# Altium project a0206-2006.PrjPcb (part 5 of 5)

## Sheet a0206-2006.17.SchDoc
size 558 x 431 mm
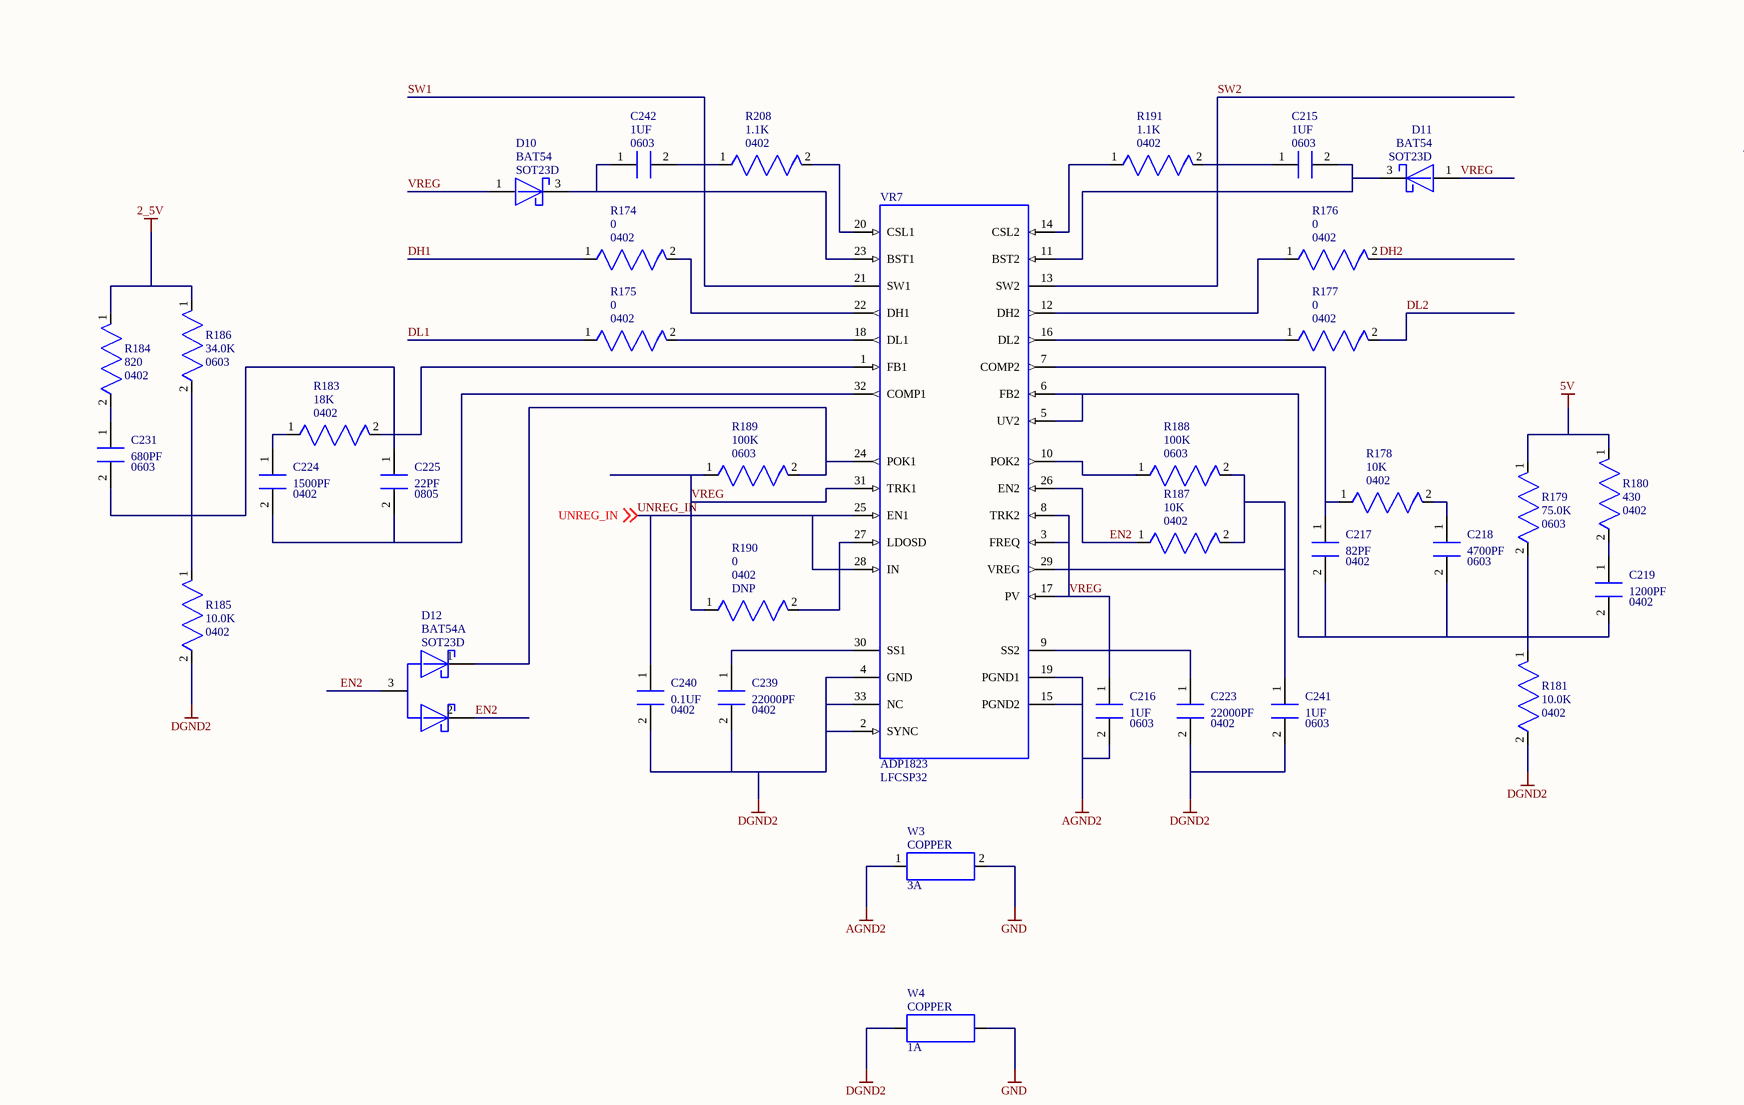
[diagram p57: a0206-2006.17.SchDoc, top left]
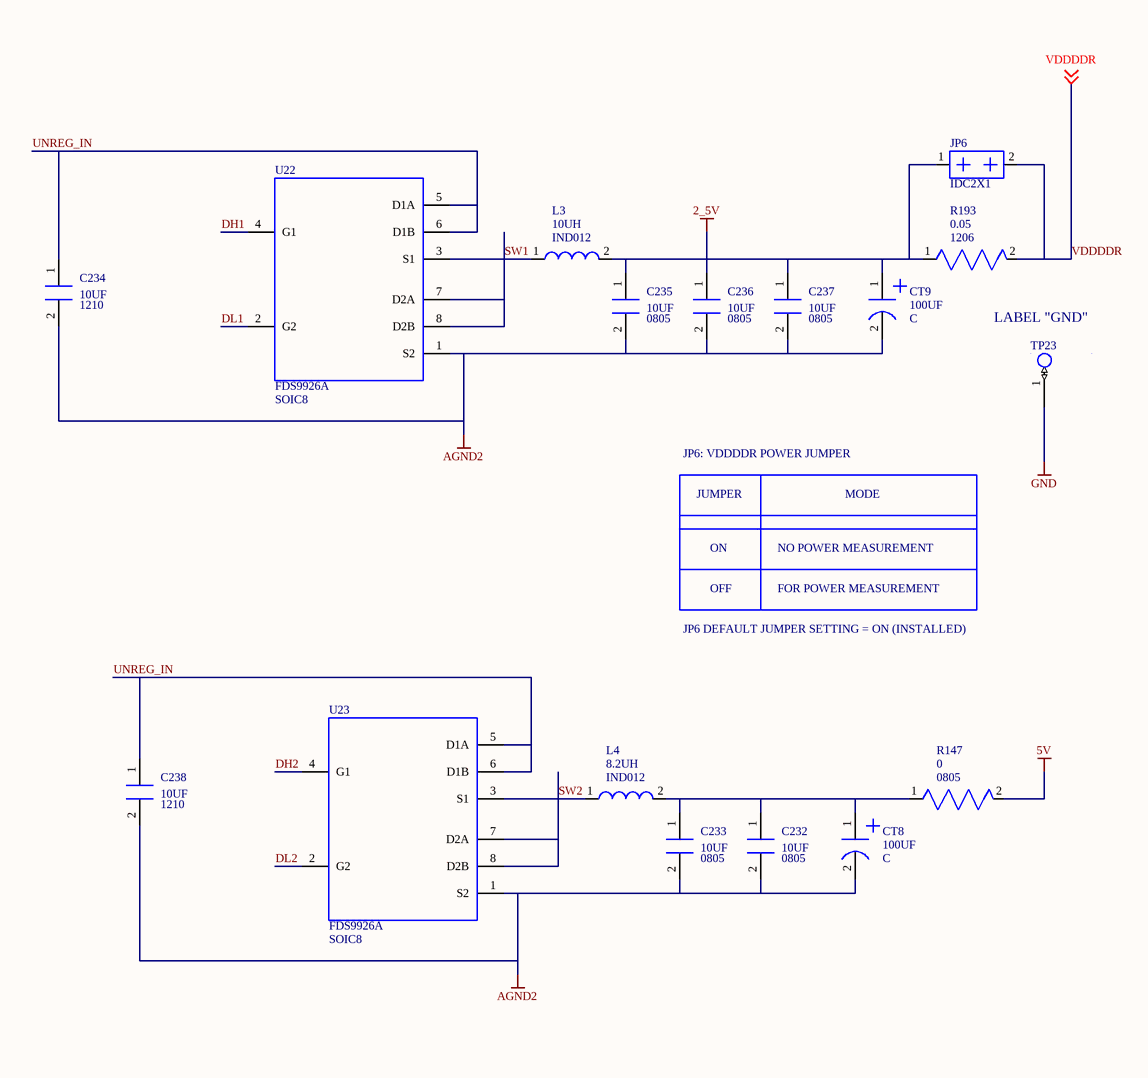
[diagram p58: a0206-2006.17.SchDoc, top right]
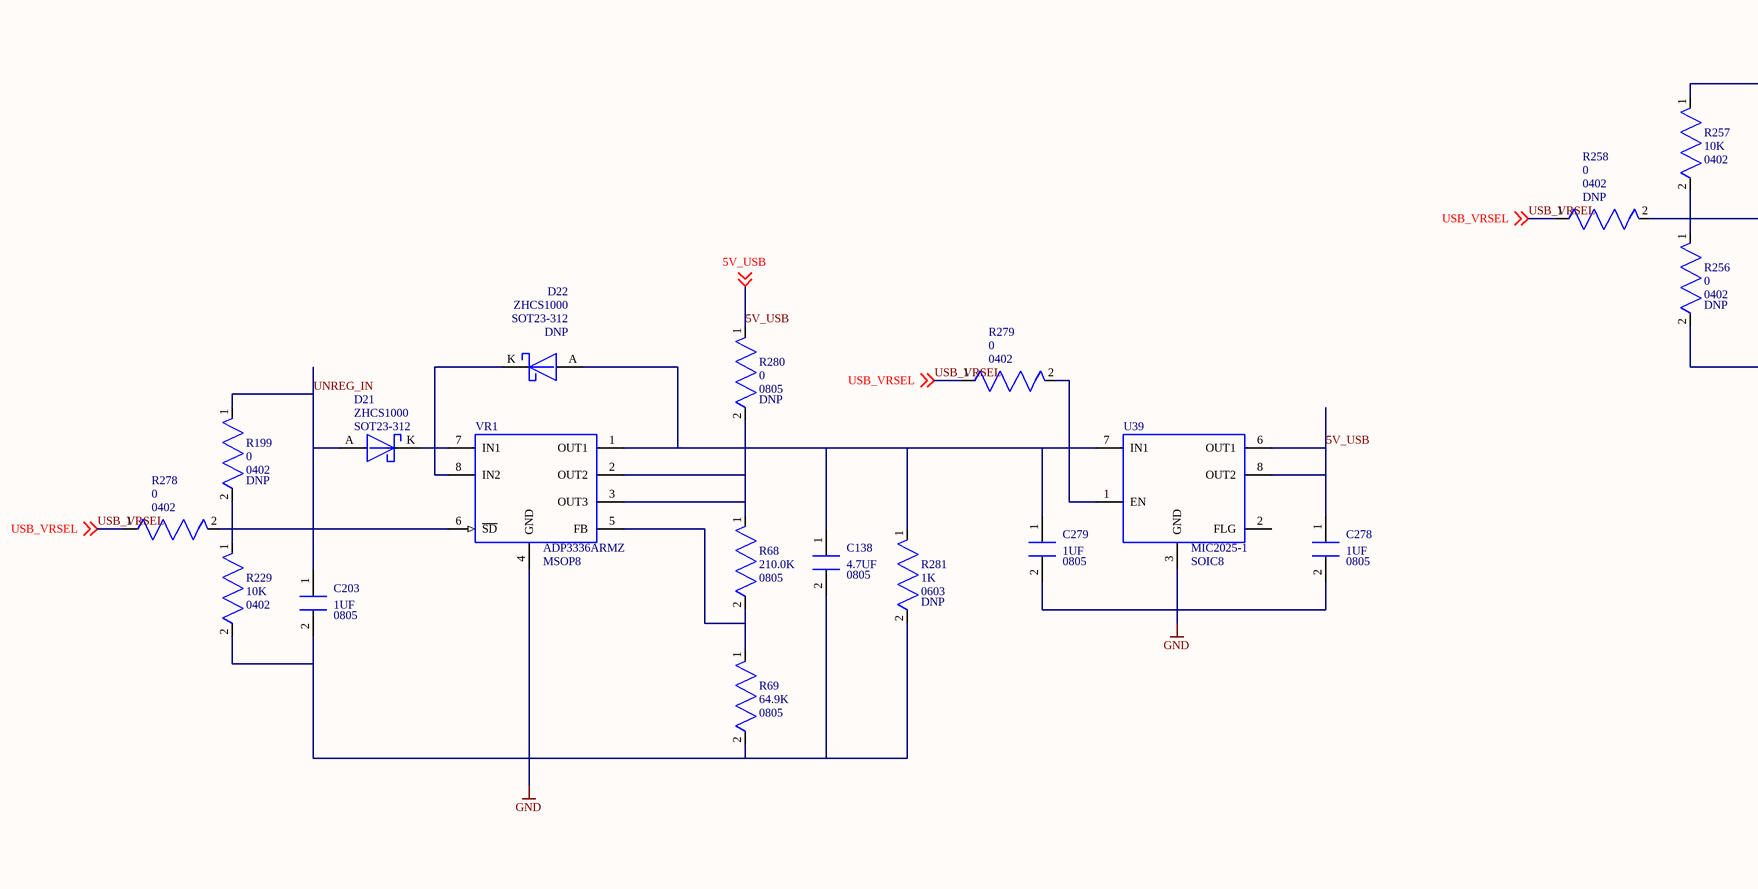
[diagram p59: a0206-2006.17.SchDoc, bottom left]
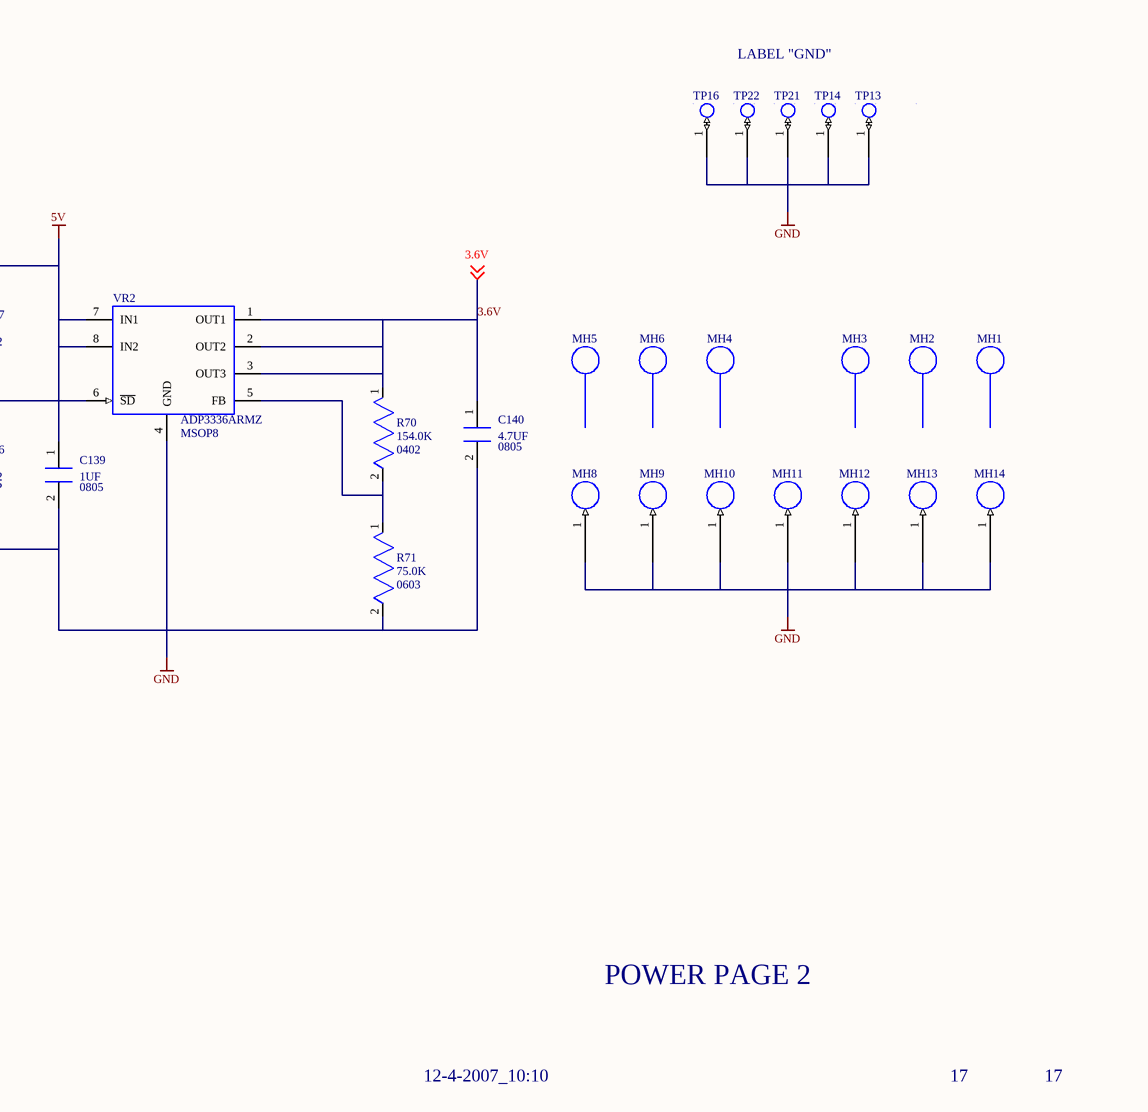
[diagram p60: a0206-2006.17.SchDoc, bottom right]

### Parts
C138  value 4.7UF  [0805]  (hidden comment: *)
C139  value 1UF  [0805]  (hidden comment: *)
C140  value 4.7UF  [0805]  (hidden comment: *)
C203  value 1UF  [0805]  (hidden comment: *)
C215  value 1UF  [0603]  (hidden comment: *)
C216  value 1UF  [0603]  (hidden comment: *)
C217  value 82PF  [0402]  (hidden comment: *)
C218  value 4700PF  [0603]  (hidden comment: *)
C219  value 1200PF  [0402]  (hidden comment: *)
C223  value 22000PF  [0402]  (hidden comment: *)
C224  value 1500PF  [0402]  (hidden comment: *)
C225  value 22PF  [0805]  (hidden comment: *)
C231  value 680PF  [0603]  (hidden comment: *)
C232  value 10UF  [0805]  (hidden comment: *)
C233  value 10UF  [0805]  (hidden comment: *)
C234  value 10UF  [1210]  (hidden comment: *)
C235  value 10UF  [0805]  (hidden comment: *)
C236  value 10UF  [0805]  (hidden comment: *)
C237  value 10UF  [0805]  (hidden comment: *)
C238  value 10UF  [1210]  (hidden comment: *)
C239  value 22000PF  [0402]  (hidden comment: *)
C240  value 0.1UF  [0402]  (hidden comment: *)
C241  value 1UF  [0603]  (hidden comment: *)
C242  value 1UF  [0603]  (hidden comment: *)
C278  value 1UF  [0805]  (hidden comment: *)
C279  value 1UF  [0805]  (hidden comment: *)
CT8  value 100UF  [C]  (hidden comment: *)
CT9  value 100UF  [C]  (hidden comment: *)
D10  PART: BAT54  [SOT23D]  (hidden comment: *)
D11  PART: BAT54  [SOT23D]  (hidden comment: *)
D12  PART: BAT54A  [SOT23D]  (hidden comment: *)
D21  PART: ZHCS1000  [SOT23-312]  (hidden comment: *)
D22  PART: ZHCS1000  CLASS: DNP  [SOT23-312]  (hidden comment: *)
JP6  *  [IDC2X1]  (value not drawn)
L3  value 10UH  [IND012]  (hidden comment: *)
L4  value 8.2UH  [IND012]  (hidden comment: *)
MH1  *  [MSC004]  (value not drawn)
MH2  *  [MSC004]  (value not drawn)
MH3  *  [MSC004]  (value not drawn)
MH4  *  [MSC004]  (value not drawn)
MH5  *  [MSC004]  (value not drawn)
MH6  *  [MSC004]  (value not drawn)
MH8  *  [MSC006]  (value not drawn)
MH9  *  [MSC006]  (value not drawn)
MH10  *  [MSC006]  (value not drawn)
MH11  *  [MSC006]  (value not drawn)
MH12  *  [MSC006]  (value not drawn)
MH13  *  [MSC006]  (value not drawn)
MH14  *  [MSC006]  (value not drawn)
R68  value 210.0K  [0805]  (hidden comment: *)
R69  value 64.9K  [0805]  (hidden comment: *)
R70  value 154.0K  [0402]  (hidden comment: *)
R71  value 75.0K  [0603]  (hidden comment: *)
R147  value 0  [0805]  (hidden comment: *)
R174  value 0  [0402]  (hidden comment: *)
R175  value 0  [0402]  (hidden comment: *)
R176  value 0  [0402]  (hidden comment: *)
R177  value 0  [0402]  (hidden comment: *)
R178  value 10K  [0402]  (hidden comment: *)
R179  value 75.0K  [0603]  (hidden comment: *)
R180  value 430  [0402]  (hidden comment: *)
R181  value 10.0K  [0402]  (hidden comment: *)
R183  value 18K  [0402]  (hidden comment: *)
R184  value 820  [0402]  (hidden comment: *)
R185  value 10.0K  [0402]  (hidden comment: *)
R186  value 34.0K  [0603]  (hidden comment: *)
R187  value 10K  [0402]  (hidden comment: *)
R188  value 100K  [0603]  (hidden comment: *)
R189  value 100K  [0603]  (hidden comment: *)
R190  value 0  CLASS: DNP  [0402]  (hidden comment: *)
R191  value 1.1K  [0402]  (hidden comment: *)
R193  value 0.05  [1206]  (hidden comment: *)
R199  value 0  CLASS: DNP  [0402]  (hidden comment: *)
R208  value 1.1K  [0402]  (hidden comment: *)
R229  value 10K  [0402]  (hidden comment: *)
R256  value 0  CLASS: DNP  [0402]  (hidden comment: *)
R257  value 10K  [0402]  (hidden comment: *)
R258  value 0  CLASS: DNP  [0402]  (hidden comment: *)
R278  value 0  [0402]  (hidden comment: *)
R279  value 0  [0402]  (hidden comment: *)
R280  value 0  CLASS: DNP  [0805]  (hidden comment: *)
R281  value 1K  CLASS: DNP  [0603]  (hidden comment: *)
TP13  *  [TP]  (value not drawn)
TP14  *  [TP]  (value not drawn)
TP16  *  [TP]  (value not drawn)
TP21  *  [TP]  (value not drawn)
TP22  *  [TP]  (value not drawn)
TP23  *  [TP]  (value not drawn)
U22  PART: FDS9926A  [SOIC8]  (hidden comment: *)
U23  PART: FDS9926A  [SOIC8]  (hidden comment: *)
U39  PART: MIC2025-1  [SOIC8]  (hidden comment: *)
VR1  PART: ADP3336ARMZ  [MSOP8]  (hidden comment: *)
VR2  PART: ADP3336ARMZ  [MSOP8]  (hidden comment: *)
VR7  PART: ADP1823  [LFCSP32]  (hidden comment: *)
W3  value COPPER  [3A]  (hidden comment: *)
W4  value COPPER  [1A]  (hidden comment: *)

### Nets
2_5V: C235.1(A) C236.1(A) C237.1(A) CT9.1(P) JP6.1 L3.2(B) R184.1(N1) R186.1(N1) R193.1(N1)
5V: C139.1(A) R147.2(N2) R179.1(N1) R180.1(N1) R257.1(N1) VR2.7(IN1) VR2.8(IN2)
AGND2: C216.2(B) C232.2(B) C233.2(B) C234.2(B) C235.2(B) C236.2(B) C237.2(B) C238.2(B) CT8.2(N) CT9.2(N) U22.1(S2) U23.1(S2) VR7.15(PGND2) VR7.19(PGND1) W3.1(N1)
DGND2: C223.2(B) C239.2(B) C240.2(B) C241.2(B) R181.2(N2) R185.2(N2) VR7.2(SYNC) VR7.4(GND) VR7.33(NC) W4.1(N1)
GND: C138.2(B) C139.2(B) C140.2(B) C203.2(B) C278.2(B) C279.2(B) MH8.1(TP) MH9.1(TP) MH10.1(TP) MH11.1(TP) MH12.1(TP) MH13.1(TP) MH14.1(TP) R69.2(N2) R71.2(N2) R229.2(N2) R256.2(N2) R281.2(N2) TP13.1(TP) TP14.1(TP) TP16.1(TP) TP21.1(TP) TP22.1(TP) TP23.1(TP) U39.3(GND) VR1.4(GND) VR2.4(GND) W3.2(N2) W4.2(N2)
3.6V: C140.1(A) R70.1(N1) VR2.1(OUT1) VR2.2(OUT2) VR2.3(OUT3) ; off-sheet 3.6V
5V_USB: C278.1(A) R280.1(N1) U39.6(OUT1) U39.8(OUT2) ; off-sheet 5V_USB
DH1: R174.1(N1) U22.4(G1)
DH2: R176.2(N2) U23.4(G1)
DL1: R175.1(N1) U22.2(G2)
DL2: R177.2(N2) U23.2(G2)
EN2: D12.2(CATHODE_B) D12.3(ANODE) R187.1(N1) VR7.26(EN2)
SW1: C242.2(B) L3.1(A) R208.1(N1) U22.3(S1) U22.7(D2A) U22.8(D2B) VR7.21(SW1)
SW2: C215.1(A) L4.1(A) R191.2(N2) U23.3(S1) U23.7(D2A) U23.8(D2B) VR7.13(SW2)
UNREG_IN: C203.1(A) C234.1(A) C238.1(A) C240.1(A) D21.A(ANODE) R199.1(N1) U22.5(D1A) U22.6(D1B) U23.5(D1A) U23.6(D1B) VR7.25(EN1) VR7.28(IN) ; off-sheet UNREG_IN
USB_VRSEL: R258.1(N1) R278.1(N1) R279.1(N1) ; off-sheet USB_VRSEL
VDDDDR: JP6.2 R193.2(N2) ; off-sheet VDDDDR
VREG: C216.1(A) C241.1(A) D10.1(ANODE) D11.1(ANODE) R187.2(N2) R188.2(N2) R189.1(N1) R190.1(N1) VR7.3(FREQ) VR7.8(TRK2) VR7.17(PV) VR7.29(VREG) VR7.31(TRK1)
NetC138_1: C138.1(A) C279.1(A) D22.A(ANODE) R68.1(N1) R280.2(N2) R281.1(N1) U39.7(IN1) VR1.1(OUT1) VR1.2(OUT2) VR1.3(OUT3)
NetC215_2: C215.2(B) D11.3(CATHODE) VR7.11(BST2)
NetC217_1: C217.1(A) R178.1(N1) VR7.7(COMP2)
NetC217_2: C217.2(B) C218.2(B) C219.2(B) R179.2(N2) R181.1(N1) VR7.5(UV2) VR7.6(FB2)
NetC218_1: C218.1(A) R178.2(N2)
NetC219_1: C219.1(A) R180.2(N2)
NetC223_1: C223.1(A) VR7.9(SS2)
NetC224_1: C224.1(A) R183.1(N1)
NetC224_2: C224.2(B) C225.2(B) VR7.32(COMP1)
NetC225_1: C225.1(A) C231.2(B) R183.2(N2) R185.1(N1) R186.2(N2) VR7.1(FB1)
NetC231_1: C231.1(A) R184.2(N2)
NetC232_1: C232.1(A) C233.1(A) CT8.1(P) L4.2(B) R147.1(N1)
NetC239_1: C239.1(A) VR7.30(SS1)
NetC242_1: C242.1(A) D10.3(CATHODE) VR7.23(BST1)
NetD12_1: D12.1(CATHODE_A) R189.2(N2) VR7.24(POK1)
NetD21_K: D21.K(CATHODE) D22.K(CATHODE) VR1.7(IN1) VR1.8(IN2)
NetR68_2: R68.2(N2) R69.1(N1) VR1.5(FB)
NetR70_2: R70.2(N2) R71.1(N1) VR2.5(FB)
NetR174_2: R174.2(N2) VR7.22(DH1)
NetR175_2: R175.2(N2) VR7.18(DL1)
NetR176_1: R176.1(N1) VR7.12(DH2)
NetR177_1: R177.1(N1) VR7.16(DL2)
NetR188_1: R188.1(N1) VR7.10(POK2)
NetR190_2: R190.2(N2) VR7.27(LDOSD)
NetR191_1: R191.1(N1) VR7.14(CSL2)
NetR199_2: R199.2(N2) R229.1(N1) R278.2(N2) VR1.6(~{SD})
NetR208_2: R208.2(N2) VR7.20(CSL1)
NetR256_1: R256.1(N1) R257.2(N2) R258.2(N2) VR2.6(~{SD})
NetR279_2: R279.2(N2) U39.1(EN)

Not connected (* = marked no-connect by the designer): D10 2; D11 2; MH1 1; MH2 1; MH3 1; MH4 1; MH5 1; MH6 1; U39 2(FLG) 4 5

### Notes on the sheet
- LABEL "GND"
- JP6: VDDDDR POWER JUMPER
- JUMPER
- ON
- NO POWER MEASUREMENT
- MODE
- OFF
- FOR POWER MEASUREMENT
- JP6 DEFAULT JUMPER SETTING = ON (INSTALLED)
- POWER PAGE 2
- 12-4-2007_10:10
- 17
- A
- B
- C
- D
- 1
- 2
- 3
- 20 Cotton Road
- 4
- DEVICES
- ANALOG
- Nashua, NH 03063
- PH: 1-800-ANALOGD
- Title
- ADSP-BF548 EZ-KIT LITE
- Size
- Board No.
- A0206-2006
- Rev
- 1.4B
- Date
- Sheet
- of

### Library data of the parts
C138 = CAP_NON_POLARIZED.2: PART_SPEC: CAPACITOR; LEVEL: STD; PRT_NUM: 7000275; VOLTAGE: 6.3V; TOLERANCE: 10%; TYPE: X5R; PKG_TYPE: 0805; ROHS: ROHS
C139 C278 = CAP_NON_POLARIZED.2: PART_SPEC: CAPACITOR; LEVEL: STD; TYPE: X7R; TOLERANCE: 10%; VOLTAGE: 16V; PRT_NUM: 7000143; PKG_TYPE: 0805; ROHS: ROHS
C140 = CAP_NON_POLARIZED.2: PART_SPEC: CAPACITOR; LEVEL: STD; TYPE: X5R; TOLERANCE: 10%; VOLTAGE: 6.3V; PRT_NUM: 7000275; PKG_TYPE: 0805; ROHS: ROHS
C203 C279 = CAP_NON_POLARIZED.2: PART_SPEC: CAPACITOR; LEVEL: STD; PRT_NUM: 7000143; VOLTAGE: 16V; TOLERANCE: 10%; TYPE: X7R; PKG_TYPE: 0805; ROHS: ROHS
C215 C242 = CAP_NON_POLARIZED.1: PART_SPEC: CAPACITOR; LEVEL: STD; PRT_NUM: 7000344; TYPE: X5R; VOLTAGE: 16V; TOLERANCE: 10%; PKG_TYPE: 0603; ROHS: ROHS
C216 = CAP_NON_POLARIZED.2: PART_SPEC: CAPACITOR; LEVEL: STD; TOLERANCE: 10%; VOLTAGE: 16V; TYPE: X5R; PRT_NUM: 7000344; PKG_TYPE: 0603; ROHS: ROHS
C217 = CAP_NON_POLARIZED.2: PART_SPEC: CAPACITOR; LEVEL: STD; PRT_NUM: 7000548; TYPE: NPO; VOLTAGE: 50V; TOLERANCE: 5%; PKG_TYPE: 0402; ROHS: ROHS
C218 = CAP_NON_POLARIZED.2: PART_SPEC: CAPACITOR; LEVEL: STD; PRT_NUM: 7000387; TYPE: X7R; VOLTAGE: 16V; TOLERANCE: 10%; PKG_TYPE: 0603; ROHS: ROHS
C219 = CAP_NON_POLARIZED.2: PART_SPEC: CAPACITOR; LEVEL: STD; PRT_NUM: 7000546; TYPE: X7R; VOLTAGE: 50V; TOLERANCE: 10%; PKG_TYPE: 0402; ROHS: ROHS
C223 C239 = CAP_NON_POLARIZED.2: PART_SPEC: CAPACITOR; LEVEL: STD; PRT_NUM: 7000549; TYPE: X7R; VOLTAGE: 25V; TOLERANCE: 10%; PKG_TYPE: 0402; ROHS: ROHS
C224 = CAP_NON_POLARIZED.2: PART_SPEC: CAPACITOR; LEVEL: STD; PRT_NUM: 7000550; TYPE: X7R; VOLTAGE: 50V; TOLERANCE: 10%; PKG_TYPE: 0402; ROHS: ROHS
C225 = CAP_NON_POLARIZED.2: PART_SPEC: CAPACITOR; LEVEL: STD; PRT_NUM: 7000028; TYPE: NPO; VOLTAGE: 50V; TOLERANCE: 5%; PKG_TYPE: 0805; ROHS: ROHS
C231 = CAP_NON_POLARIZED.2: PART_SPEC: CAPACITOR; LEVEL: STD; PRT_NUM: 7000413; TYPE: NPO; VOLTAGE: 50V; TOLERANCE: 5%; PKG_TYPE: 0603; ROHS: ROHS
C232 C236 = CAP_NON_POLARIZED.2: PART_SPEC: CAPACITOR; LEVEL: STD; TOLERANCE: 10%; VOLTAGE: 6.3V; TYPE: X5R; PRT_NUM: 7000265; PKG_TYPE: 0805; ROHS: ROHS
C233 C235 C237 = CAP_NON_POLARIZED.2: PART_SPEC: CAPACITOR; LEVEL: STD; PRT_NUM: 7000265; TYPE: X5R; VOLTAGE: 6.3V; TOLERANCE: 10%; PKG_TYPE: 0805; ROHS: ROHS
C234 = CAP_NON_POLARIZED.2: PART_SPEC: CAPACITOR; LEVEL: STD; PRT_NUM: 7000492; TYPE: X5R; VOLTAGE: 16V; TOLERANCE: 10%; PKG_TYPE: 1210; ROHS: ROHS
C238 = CAP_NON_POLARIZED.2: PART_SPEC: CAPACITOR; LEVEL: STD; TOLERANCE: 10%; VOLTAGE: 16V; TYPE: X5R; PRT_NUM: 7000492; PKG_TYPE: 1210; ROHS: ROHS
C240 = CAP_NON_POLARIZED.2: PART_SPEC: CAPACITOR; LEVEL: STD; PRT_NUM: 7000278; TYPE: X5R; VOLTAGE: 10V; TOLERANCE: 10%; PKG_TYPE: 0402; ROHS: ROHS
C241 = CAP_NON_POLARIZED.2: PART_SPEC: CAPACITOR; LEVEL: STD; PRT_NUM: 7000344; TYPE: X5R; VOLTAGE: 16V; TOLERANCE: 10%; PKG_TYPE: 0603; ROHS: ROHS
CT8 = CAP_POLARIZED.3: PART_SPEC: CAPACITOR; LEVEL: STD; PRT_NUM: 7000303; VOLTAGE: 10V; TOLERANCE: 10%; PKG_TYPE: C; TYPE: TANT-LOW-ESR; ROHS: ROHS
CT9 = CAP_POLARIZED.3: PART_SPEC: CAPACITOR; LEVEL: STD; TOLERANCE: 10%; VOLTAGE: 10V; PRT_NUM: 7000303; PKG_TYPE: C; ROHS: ROHS; TYPE: TANT-LOW-ESR
D10 D11 = DIO_SCHOTTYKY_BAT54.1: SCHOTTKY 30V SINGLE; LEVEL: STD; CURRENT: 200MA; NC: 2; PRT_NUM: 7000534; PKG_TYPE: SOT23D; ROHS: ROHS; WEB: http://www.fairchildsemi.com/pf/BA/BAT54.html
D12 = DIO_SCHOTTYKY_BAT54A.1: SCHOTTKY 30V DUAL; LEVEL: STD; CURRENT: 200MA; PRT_NUM: 7000533; PKG_TYPE: SOT23D; ROHS: ROHS; WEB: http://www.fairchildsemi.com/pf/BA/BAT54A.html
D21 D22 = DIO_SCHOTTKY_3.3: SCHOTTKY; LEVEL: STD; CURRENT: 1A; PRT_NUM: 7000252; PKG_TYPE: SOT23-312; WEB: http://www.zetex.com/3.0/3-3-3.asp?pn; ROHS: ROHS
JP6 = CON_2X1.2: HEADER; PART_SPEC: CONNECTOR; LEVEL: STD; PRT_NUM: 6000774; CONFIGURATION: 2X1; PKG_TYPE: IDC2X1; TYPE: IDC; ROHS: ROHS
L3 = IND_STANDARD.1: PART_SPEC: INDUCTOR; LEVEL: STD; PRT_NUM: 7000536; TOLERANCE: 20%; PKG_TYPE: IND012; ROHS: ROHS
L4 = IND_STANDARD.1: PART_SPEC: INDUCTOR; LEVEL: STD; PRT_NUM: 7000535; TOLERANCE: 20%; PKG_TYPE: IND012; ROHS: ROHS
MH1-MH6 = MSC_MOUNTING_HOLE_NC.1: MOUNTING HOLE; NC: 1; CLASS: DNP; LEVEL: STD; ROHS: ROHS; PART: HOLE; PART_SPEC: HOLE; PKG_TYPE: MSC004
MH8-MH14 = MSC_MOUNTING_HOLE.1: MOUNTING HOLE; CLASS: DNP; LEVEL: STD; ROHS: ROHS; PART: HOLE; PART_SPEC: HOLE; PKG_TYPE: MSC006
R68 = RES_STANDARD.2: PART_SPEC: RESISTOR; LEVEL: STD; TOLERANCE: 1%; PRT_NUM: 7000311; POWER: 1/4W; PKG_TYPE: 0805; ROHS: ROHS
R69 = RES_STANDARD.2: PART_SPEC: RESISTOR; LEVEL: STD; TOLERANCE: 1%; PRT_NUM: 7000309; POWER: 1/10W; PKG_TYPE: 0805; ROHS: ROHS
R70 = RES_STANDARD.2: PART_SPEC: RESISTOR; LEVEL: STD; POWER: 1/16W; PRT_NUM: 7000576; TOLERANCE: 1%; PKG_TYPE: 0402; ROHS: ROHS
R71 = RES_STANDARD.2: PART_SPEC: RESISTOR; LEVEL: STD; POWER: 1/16W; PRT_NUM: 7000378; TOLERANCE: 1%; PKG_TYPE: 0603; ROHS: ROHS
R147 = RES_STANDARD.1: PART_SPEC: RESISTOR; LEVEL: STD; PRT_NUM: 7000228; POWER: 1/10W; TOLERANCE: 5%; PKG_TYPE: 0805; ROHS: ROHS
R174-R177 R278 = RES_STANDARD.1: PART_SPEC: RESISTOR; LEVEL: STD; PRT_NUM: 7000282; POWER: 1/16W; TOLERANCE: 5%; PKG_TYPE: 0402; ROHS: ROHS
R178 R187 = RES_STANDARD.1: PART_SPEC: RESISTOR; LEVEL: STD; PRT_NUM: 7000280; POWER: 1/16W; TOLERANCE: 5%; PKG_TYPE: 0402; ROHS: ROHS
R179 = RES_STANDARD.2: PART_SPEC: RESISTOR; LEVEL: STD; PRT_NUM: 7000378; POWER: 1/16W; TOLERANCE: 1%; PKG_TYPE: 0603; ROHS: ROHS
R180 = RES_STANDARD.2: PART_SPEC: RESISTOR; LEVEL: STD; PRT_NUM: 7000544; POWER: 1/16W; TOLERANCE: 1%; PKG_TYPE: 0402; ROHS: ROHS
R181 R185 = RES_STANDARD.2: PART_SPEC: RESISTOR; LEVEL: STD; PRT_NUM: 7000582; POWER: 1/16W; TOLERANCE: 1%; PKG_TYPE: 0402; ROHS: ROHS
R183 = RES_STANDARD.1: PART_SPEC: RESISTOR; LEVEL: STD; PRT_NUM: 7000539; POWER: 1/16W; TOLERANCE: 5%; PKG_TYPE: 0402; ROHS: ROHS
R184 = RES_STANDARD.2: PART_SPEC: RESISTOR; LEVEL: STD; PRT_NUM: 7000542; POWER: 1/16W; TOLERANCE: 5%; PKG_TYPE: 0402; ROHS: ROHS
R186 = RES_STANDARD.2: PART_SPEC: RESISTOR; LEVEL: STD; PRT_NUM: 7000609; POWER: 1/10W; TOLERANCE: 1%; PKG_TYPE: 0603; ROHS: ROHS
R188 = RES_STANDARD.1: PART_SPEC: RESISTOR; LEVEL: STD; TOLERANCE: 5%; POWER: 1/10W; PRT_NUM: 7000367; PKG_TYPE: 0603; ROHS: ROHS
R189 = RES_STANDARD.1: PART_SPEC: RESISTOR; LEVEL: STD; PRT_NUM: 7000367; POWER: 1/10W; TOLERANCE: 5%; PKG_TYPE: 0603; ROHS: ROHS
R190 R258 R279 = RES_STANDARD.1: PART_SPEC: RESISTOR; LEVEL: STD; TOLERANCE: 5%; POWER: 1/16W; PRT_NUM: 7000282; PKG_TYPE: 0402; ROHS: ROHS
R191 R208 = RES_STANDARD.1: PART_SPEC: RESISTOR; LEVEL: STD; PRT_NUM: 7000538; POWER: 1/16W; TOLERANCE: 1%; PKG_TYPE: 0402; ROHS: ROHS
R193 = RES_STANDARD.1: PART_SPEC: RESISTOR; LEVEL: STD; TOLERANCE: 1%; POWER: 1/2W; PRT_NUM: 7000486; PKG_TYPE: 1206; ROHS: ROHS
R199 = RES_STANDARD.2: PART_SPEC: RESISTOR; LEVEL: STD; TOLERANCE: 5%; POWER: 1/16W; PRT_NUM: 7000282; PKG_TYPE: 0402; ROHS: ROHS
R229 = RES_STANDARD.2: PART_SPEC: RESISTOR; LEVEL: STD; PRT_NUM: 7000280; POWER: 1/16W; TOLERANCE: 5%; PKG_TYPE: 0402; ROHS: ROHS
R256 = RES_STANDARD.2: PART_SPEC: RESISTOR; LEVEL: STD; PRT_NUM: 7000282; POWER: 1/16W; TOLERANCE: 5%; PKG_TYPE: 0402; ROHS: ROHS
R257 = RES_STANDARD.2: PART_SPEC: RESISTOR; LEVEL: STD; TOLERANCE: 5%; POWER: 1/16W; PRT_NUM: 7000280; PKG_TYPE: 0402; ROHS: ROHS
R280 = RES_STANDARD.2: PART_SPEC: RESISTOR; LEVEL: STD; PRT_NUM: 7000228; POWER: 1/10W; TOLERANCE: 5%; PKG_TYPE: 0805; ROHS: ROHS
R281 = RES_STANDARD.2: PART_SPEC: RESISTOR; LEVEL: STD; POWER: 1/10W; PRT_NUM: 7000384; TOLERANCE: 5%; PKG_TYPE: 0603; ROHS: ROHS
TP13 TP14 TP16 TP21-TP23 = MSC_TEST_POINT.1: TESTPOINT; CLASS: DNP; LEVEL: STD; BOARDS: BOTH; PART_SPEC: TESTPOINT; PART: TESTPOINT; ROHS: ROHS; PKG_TYPE: TP
U22 U23 = ICS_FDS9926A.1: 2.5V DUAL N-MOSFETS; LEVEL: STD; PRT_NUM: 1000413; WEB: http://www.fairchildsemi.com/pf/FD/FDS9926A.html; PKG_TYPE: SOIC8; ROHS: ROHS
U39 = ICS_MIC2025.1: PWR DIST MOSFET 0.5A; LEVEL: STD; NC: 4,5; PRT_NUM: 1000443; WEB: http://www.micrel.com/_PDF/mic2025.pdf; PKG_TYPE: SOIC8; ROHS: ROHS
VR1 VR2 = ICS_ADP3336.1: ADJ 500MA REGULATOR; LEVEL: STD; PRT_NUM: 30-025190-01; PKG_TYPE: MSOP8; WEB: HTTP://WWW.ANALOG.COM/EN/PROD/0%2C2877%2CADP3336%2C00.HTML; ROHS: ROHS
VR7 = ICS_ADP1823.1: DUAL STEPDOWN CONTROLLER; LEVEL: STD; PRT_NUM: 30-025759-01; WEB: http://www.analog.com/en/prod/0,2877,ADP1823,00.html; PKG_TYPE: LFCSP32; ROHS: ROHS
W3 W4 = MSC_COPPER.1: LEVEL: STD; CLASS: DNP
  W3: PKG_TYPE: 3A
  W4: PKG_TYPE: 1A

## Nets that join several sheets
2_5V: a0206-2006.2 (19 pins), a0206-2006.17 (9 pins)
3V: a0206-2006.3 (28 pins), a0206-2006.4 (10 pins), a0206-2006.5 (10 pins), a0206-2006.7 (5 pins), a0206-2006.8 (10 pins), a0206-2006.9 (29 pins), a0206-2006.10 (10 pins), a0206-2006.11 (7 pins), mxvr.1 (C22.1 R231.1 U8.4), a0206-2006.12 (17 pins), a0206-2006.13 (20 pins), a0206-2006.14 (15 pins), a0206-2006.15 (15 pins), a0206-2006.16 (18 pins)
5V: a0206-2006.8 (9 pins), a0206-2006.10 (6 pins), mxvr.1 (6 pins), a0206-2006.12 (6 pins), a0206-2006.14 (6 pins), a0206-2006.15 (10 pins), a0206-2006.17 (7 pins)
A5V: a0206-2006.7 (8 pins), a0206-2006.16 (C204.1 FER17.2)
AGND: a0206-2006.7 (41 pins), a0206-2006.16 (C204.2)
GND: a0206-2006.2 (19 pins), a0206-2006.3 (19 pins), a0206-2006.4 (8 pins), a0206-2006.5 (20 pins), a0206-2006.6 (142 pins), a0206-2006.7 (14 pins), a0206-2006.8 (48 pins), a0206-2006.9 (48 pins), a0206-2006.10 (20 pins), a0206-2006.11 (8 pins), mxvr.1 (12 pins), a0206-2006.12 (53 pins), a0206-2006.13 (28 pins), a0206-2006.14 (34 pins), a0206-2006.15 (22 pins), a0206-2006.16 (29 pins), a0206-2006.17 (29 pins)
3.6V: a0206-2006.8 (D2.A), a0206-2006.17 (5 pins)
5V_USB: a0206-2006.8 (5 pins), a0206-2006.17 (C278.1 R280.1 U39.6 U39.8)
#HPCE/CNTCZM: a0206-2006.5 (P3.6 SW4.6 U2.V15), a0206-2006.15 (U26.4)
A1: a0206-2006.3 (U2.B2 U5.A1), a0206-2006.14 (J1.6)
A2: a0206-2006.3 (U2.A2 U5.B1), a0206-2006.14 (J1.7)
A3: a0206-2006.3 (U2.B3 U5.C1), a0206-2006.14 (J1.8)
A4: a0206-2006.3 (U2.D5 U5.D1), a0206-2006.14 (J1.9)
A5: a0206-2006.3 (U2.C4 U5.D2), a0206-2006.14 (J1.10)
A6: a0206-2006.3 (U2.C7 U5.A2), a0206-2006.14 (J1.11)
A7: a0206-2006.3 (U2.C5 U5.C2), a0206-2006.14 (J1.12)
A8: a0206-2006.3 (U2.D7 U5.A3), a0206-2006.14 (J1.13)
A9: a0206-2006.3 (U2.C6 U5.B3), a0206-2006.14 (J1.14)
A10: a0206-2006.3 (U2.A3 U5.C3), a0206-2006.14 (J1.15)
A11: a0206-2006.3 (U2.B4 U5.D3), a0206-2006.14 (J1.16)
A12: a0206-2006.3 (U2.A4 U5.C4), a0206-2006.14 (J1.17)
A13: a0206-2006.3 (U2.B5 U5.A5), a0206-2006.14 (J1.18)
A14: a0206-2006.3 (U2.A5 U5.B5), a0206-2006.14 (J1.19)
A15: a0206-2006.3 (U2.B6 U5.C5), a0206-2006.14 (J1.20)
A16: a0206-2006.3 (U2.A6 U5.D7), a0206-2006.14 (J1.21)
A17: a0206-2006.3 (U2.B7 U5.D8), a0206-2006.14 (J1.22)
A18: a0206-2006.3 (U2.A7 U5.A7), a0206-2006.14 (J1.23)
A19: a0206-2006.3 (U2.C8 U5.B7), a0206-2006.14 (J1.24)
A20: a0206-2006.3 (U2.B8 U5.C7), a0206-2006.14 (J1.25)
A21: a0206-2006.3 (U2.A8 U5.C8), a0206-2006.14 (J1.26)
A22: a0206-2006.3 (U2.A9 U5.A8), a0206-2006.14 (J1.27)
A23: a0206-2006.3 (U2.C9 U5.G1), a0206-2006.14 (J1.28)
A24: a0206-2006.3 (U2.D8 U5.H8), a0206-2006.14 (J1.29)
~{ABE0/NDCLE}: a0206-2006.3 (U2.C17 U3.16), a0206-2006.14 (J2.66)
~{ABE1/NDALE}: a0206-2006.3 (U2.C16 U3.17), a0206-2006.14 (J2.64)
~{AMS0}: a0206-2006.3 (U2.A10 U5.B4), a0206-2006.14 (J2.65)
~{AMS1}: a0206-2006.3 (U2.D9), a0206-2006.9 (U14.94), a0206-2006.14 (J2.63)
~{AMS2}: a0206-2006.3 (U2.B10), a0206-2006.14 (J2.61)
~{AMS3}: a0206-2006.3 (U2.D10), a0206-2006.14 (J2.59)
~{AOE}: a0206-2006.3 (U2.C10 U5.F6), a0206-2006.14 (J2.68)
~{ARE}: a0206-2006.3 (U2.B12 U3.8 U5.F8), a0206-2006.9 (U14.92), a0206-2006.14 (J2.69)
~{ATAPICS0}: a0206-2006.3 (U2.U20), a0206-2006.8 (R168.1 U24.35 U35.1)
~{ATAPICS1}: a0206-2006.3 (U2.P18), a0206-2006.8 (R198.1 U24.34 U35.2)
~{ATAPIDIOR}: a0206-2006.3 (U2.T20), a0206-2006.8 (U24.39)
~{ATAPIDIOW}: a0206-2006.3 (U2.N17), a0206-2006.8 (U24.40)
~{ATAPIDMACK}: a0206-2006.3 (U2.N16), a0206-2006.8 (U24.38)
~{ATAPIDMARQ}: a0206-2006.3 (U2.R19), a0206-2006.8 (U24.42)
~{AUDIO_RESET}: a0206-2006.4 (SW16.8), a0206-2006.7 (R55.1 U11.11)
~{AWE}: a0206-2006.3 (U2.D12 U3.18 U5.G8), a0206-2006.9 (U14.93), a0206-2006.14 (J2.70)
ATAPIINTRQ: a0206-2006.3 (U2.P17), a0206-2006.8 (U24.31)
ATAPIIORDY: a0206-2006.3 (U2.T19), a0206-2006.8 (U24.33)
ATAPIPDIAG: a0206-2006.3 (U2.P19), a0206-2006.8 (U24.43)
~{BG/PJ12}: a0206-2006.3 (U2.P20), a0206-2006.14 (J3.83)
~{BGH/PJ13}: a0206-2006.3 (U2.N19), a0206-2006.14 (J3.85)
~{BR/PJ11}: a0206-2006.3 (U2.M17), a0206-2006.4 (R209.2), a0206-2006.14 (J3.81)
BOOTWAIT: a0206-2006.4 (U2.H4), a0206-2006.5 (R150.2), a0206-2006.14 (J2.20)
CAN0_ERR: a0206-2006.4 (U2.H2), a0206-2006.10 (SW6.3), a0206-2006.15 (R237.1)
CAN0RX: a0206-2006.4 (U2.R18), a0206-2006.10 (SW6.4), a0206-2006.15 (R236.1)
CAN0TX: a0206-2006.4 (U2.P16), a0206-2006.10 (U21.1)
CAN1_ERR: a0206-2006.4 (U2.G1), a0206-2006.10 (SW15.3), a0206-2006.15 (R239.1)
CAN1RX: a0206-2006.4 (U2.W13), a0206-2006.10 (SW15.4), a0206-2006.15 (R238.1)
CAN1TX: a0206-2006.4 (U2.Y13), a0206-2006.10 (U33.1)
CLKBUF: a0206-2006.4 (R21.2), a0206-2006.8 (R64.1)
CLKOUT: a0206-2006.3 (R20.2), a0206-2006.14 (J3.29)
D0: a0206-2006.3 (U2.D13 U3.29 U5.F2), a0206-2006.8 (U4.46), a0206-2006.9 (U14.64), a0206-2006.14 (J1.39)
D1: a0206-2006.3 (U2.C13 U3.30 U5.E2), a0206-2006.8 (U4.45), a0206-2006.9 (U14.63), a0206-2006.14 (J1.40)
D2: a0206-2006.3 (U2.B13 U3.31 U5.G3), a0206-2006.8 (U4.44), a0206-2006.9 (U14.62), a0206-2006.14 (J1.41)
D3: a0206-2006.3 (U2.B15 U3.32 U5.E4), a0206-2006.8 (U4.43), a0206-2006.9 (U14.59), a0206-2006.14 (J1.42)
D4: a0206-2006.3 (U2.A15 U3.41 U5.E5), a0206-2006.8 (U4.42), a0206-2006.9 (U14.58), a0206-2006.14 (J1.43)
D5: a0206-2006.3 (U2.B16 U3.42 U5.G5), a0206-2006.8 (U4.40), a0206-2006.9 (U14.57), a0206-2006.14 (J1.44)
D6: a0206-2006.3 (U2.A16 U3.43 U5.G6), a0206-2006.8 (U4.39), a0206-2006.9 (U14.56), a0206-2006.14 (J1.45)
D7: a0206-2006.3 (U2.B17 U3.44 U5.H7), a0206-2006.8 (U4.38), a0206-2006.9 (U14.53), a0206-2006.14 (J1.46)
D8: a0206-2006.3 (U2.C14 U5.E1), a0206-2006.8 (U4.35), a0206-2006.9 (U14.52), a0206-2006.14 (J1.47)
D9: a0206-2006.3 (U2.C15 U5.E3), a0206-2006.8 (U4.34), a0206-2006.9 (U14.51), a0206-2006.14 (J1.48)
D10: a0206-2006.3 (U2.A17 U5.F3), a0206-2006.8 (U4.33), a0206-2006.9 (U14.50), a0206-2006.14 (J1.49)
D11: a0206-2006.3 (U2.D14 U5.F4), a0206-2006.8 (U4.31), a0206-2006.9 (U14.49), a0206-2006.14 (J1.50)
D12: a0206-2006.3 (U2.D15 U5.F5), a0206-2006.8 (U4.30), a0206-2006.9 (U14.46), a0206-2006.14 (J1.51)
D13: a0206-2006.3 (U2.E15 U5.H5), a0206-2006.8 (U4.29), a0206-2006.9 (U14.45), a0206-2006.14 (J1.52)
D14: a0206-2006.3 (U2.E14 U5.G7), a0206-2006.8 (U4.28), a0206-2006.9 (U14.44), a0206-2006.14 (J1.53)
D15: a0206-2006.3 (U2.D17 U5.E7), a0206-2006.8 (U4.27), a0206-2006.9 (U14.43), a0206-2006.14 (J1.54)
DDR_VREF: a0206-2006.2 (5 pins), a0206-2006.6 (R260.1 U2.M20)
DR0PRI: a0206-2006.4 (U2.J5), a0206-2006.7 (U11.8)
DR2PRI: a0206-2006.4 (U2.Y11), a0206-2006.14 (J2.37), a0206-2006.15 (P6.8)
DR2SEC: a0206-2006.4 (U2.V11), a0206-2006.14 (J2.35), a0206-2006.15 (P6.10)
DR3PRI: a0206-2006.4 (U2.Y7), a0206-2006.14 (J2.29), a0206-2006.15 (P7.8)
DR3SEC: a0206-2006.4 (U2.W10), a0206-2006.14 (J2.27), a0206-2006.15 (P7.10)
DT0PRI: a0206-2006.4 (U2.J2), a0206-2006.7 (R60.1 U11.5)
DT2PRI: a0206-2006.4 (U2.W12), a0206-2006.14 (J2.38), a0206-2006.15 (P6.14)
DT2SEC: a0206-2006.4 (U2.V12), a0206-2006.14 (J2.36), a0206-2006.15 (P6.12)
DT3PRI: a0206-2006.4 (U2.Y9), a0206-2006.14 (J2.30), a0206-2006.15 (P7.14)
DT3SEC: a0206-2006.4 (U2.Y10), a0206-2006.14 (J2.28), a0206-2006.15 (P7.12)
~{EMU}: a0206-2006.4 (U2.R5), a0206-2006.14 (R212.2)
HOSTWAIT: a0206-2006.4 (SW16.4), a0206-2006.5 (P3.12 R149.1 R150.1 R214.2)
~{LAN_IRQ}: a0206-2006.4 (SW16.6), a0206-2006.9 (R75.2 U14.72)
LCD_DAV: a0206-2006.3 (R201.2 SW14.8), a0206-2006.12 (U9.23)
LCD_DISP: a0206-2006.3 (R203.1 SW14.5), a0206-2006.12 (P15.31)
LCD_IRQ: a0206-2006.3 (R202.2 SW14.7), a0206-2006.12 (U9.17)
LED1: a0206-2006.5 (P3.2 U2.Y17), a0206-2006.13 (U29.2), a0206-2006.14 (J1.79), a0206-2006.15 (U26.6)
LED2: a0206-2006.5 (P3.4 U2.W16), a0206-2006.13 (U29.4), a0206-2006.14 (J1.80), a0206-2006.15 (U26.8)
LED3: a0206-2006.4 (U2.V16), a0206-2006.13 (U29.6), a0206-2006.14 (J1.81), a0206-2006.15 (U26.15)
LED4: a0206-2006.4 (U2.Y19), a0206-2006.13 (U29.8), a0206-2006.14 (J1.82), a0206-2006.15 (R240.2)
LED5: a0206-2006.4 (U2.Y18), a0206-2006.13 (U29.11), a0206-2006.14 (J1.83), a0206-2006.15 (JP8.2 U26.13)
LED6: a0206-2006.4 (U2.U15), a0206-2006.13 (U29.13), a0206-2006.14 (J1.84), a0206-2006.15 (R232.2)
~{NMI}: a0206-2006.4 (R171.2 U2.C11), a0206-2006.14 (J2.17)
~{NOR_RESET}: a0206-2006.3 (R200.2 U25.1), a0206-2006.4 (SW16.5)
NORWAIT: a0206-2006.3 (U2.R20 U5.F7), a0206-2006.14 (J2.67)
PE3: a0206-2006.3 (SW14.4), a0206-2006.4 (U2.V14), a0206-2006.14 (J2.11)
PE7: a0206-2006.4 (SW16.2 U2.R17), a0206-2006.14 (J3.37)
PE8: a0206-2006.4 (SW16.3 U2.V20), a0206-2006.14 (J3.38)
PPI0CLK_R: a0206-2006.5 (R268.2), a0206-2006.12 (U36.2), a0206-2006.14 (J1.71)
PPI0D0_R: a0206-2006.5 (RN17.8), a0206-2006.12 (U37.2 U38.4), a0206-2006.14 (J1.72)
PPI0D1_R: a0206-2006.5 (RN17.7), a0206-2006.12 (U37.3 U38.5), a0206-2006.14 (J1.73)
PPI0D2_R: a0206-2006.5 (RN17.6), a0206-2006.12 (U37.4 U38.6), a0206-2006.14 (J1.74)
PPI0D3_R: a0206-2006.5 (RN17.5), a0206-2006.12 (U37.5 U38.7), a0206-2006.14 (J1.75)
PPI0D4_R: a0206-2006.5 (RN18.8), a0206-2006.12 (U37.6 U38.9), a0206-2006.14 (J2.43)
PPI0D5_R: a0206-2006.5 (RN18.7), a0206-2006.12 (U37.7 U38.10), a0206-2006.14 (J2.44)
PPI0D6_R: a0206-2006.5 (RN18.6), a0206-2006.12 (U37.9 U38.13), a0206-2006.14 (J2.45)
PPI0D7_R: a0206-2006.5 (RN18.5), a0206-2006.12 (U37.10 U38.14), a0206-2006.14 (J2.46)
PPI0D8_R: a0206-2006.5 (RN19.8), a0206-2006.12 (U37.11 U38.15), a0206-2006.14 (J2.47)
PPI0D9_R: a0206-2006.5 (RN19.7), a0206-2006.12 (U37.12 U38.16), a0206-2006.14 (J2.48)
PPI0D10_R: a0206-2006.5 (RN19.6), a0206-2006.12 (U37.13 U38.18), a0206-2006.14 (J2.49)
PPI0D11_R: a0206-2006.5 (RN19.5), a0206-2006.12 (U37.14 U38.20), a0206-2006.14 (J2.50)
PPI0D12_R: a0206-2006.5 (RN20.8), a0206-2006.12 (U37.15 U38.23), a0206-2006.14 (J2.51)
PPI0D13_R: a0206-2006.5 (RN20.7), a0206-2006.12 (U37.16 U38.24), a0206-2006.14 (J2.52)
PPI0D14_R: a0206-2006.5 (RN20.6), a0206-2006.12 (U37.18 U38.25), a0206-2006.14 (J2.53)
PPI0D15_R: a0206-2006.5 (RN20.5), a0206-2006.12 (U37.20 U38.26), a0206-2006.14 (J2.54)
PPI0D16_R: a0206-2006.5 (RN25.8), a0206-2006.12 (U37.21 U38.27), a0206-2006.14 (J2.55)
PPI0D17_R: a0206-2006.5 (RN25.7), a0206-2006.12 (U37.22 U38.28), a0206-2006.14 (J2.16)
PPI0FS1_R: a0206-2006.5 (RN25.6), a0206-2006.12 (U36.4), a0206-2006.14 (J2.25)
PPI0FS2_R: a0206-2006.5 (RN25.5), a0206-2006.12 (U36.6), a0206-2006.14 (J2.24)
PPI0FS3/ATAPIRESET: a0206-2006.5 (R225.1 U2.V17), a0206-2006.8 (U24.30), a0206-2006.14 (J3.45)
PPI1_SEL: a0206-2006.3 (SW14.6), a0206-2006.14 (R249.1 U20.4)
PPI1CLK_R: a0206-2006.5 (R269.2), a0206-2006.14 (U20.1), a0206-2006.15 (P8.6)
PPI1D0/HPD8_R: a0206-2006.5 (P3.15 RN22.5), a0206-2006.12 (U37.23), a0206-2006.14 (J3.2), a0206-2006.15 (P8.8)
PPI1D1/HPD9_R: a0206-2006.5 (P3.13 RN22.6), a0206-2006.12 (U37.24), a0206-2006.14 (J3.1), a0206-2006.15 (P8.9)
PPI1D2/HPD10_R: a0206-2006.5 (P3.11 RN22.7), a0206-2006.12 (U37.25), a0206-2006.14 (J3.10), a0206-2006.15 (P8.10)
PPI1D3/HPD11_R: a0206-2006.5 (P3.9 RN22.8), a0206-2006.12 (U37.26), a0206-2006.14 (J3.9), a0206-2006.15 (P8.11)
PPI1D4/HPD12_R: a0206-2006.5 (P3.7 RN21.5), a0206-2006.12 (U37.27), a0206-2006.14 (J3.12), a0206-2006.15 (P8.12)
PPI1D5/HPD13_R: a0206-2006.5 (P3.5 RN21.6), a0206-2006.12 (U37.28), a0206-2006.14 (J3.11), a0206-2006.15 (P8.13)
PPI1D6/HPD14_R: a0206-2006.5 (P3.3 RN21.7), a0206-2006.14 (J3.14), a0206-2006.15 (P8.14)
PPI1D7/HPD15_R: a0206-2006.5 (P3.1 RN21.8), a0206-2006.14 (J3.13), a0206-2006.15 (P8.15)
PPI1D8/HPD0/KPR0_R: a0206-2006.5 (P3.31 RN24.5 SW2.8), a0206-2006.14 (J3.16), a0206-2006.15 (P8.16)
PPI1D9/HPD1/KPR1_R: a0206-2006.5 (P3.29 RN24.6 SW2.7), a0206-2006.14 (J3.15), a0206-2006.15 (P8.17)
PPI1D10/HPD2/KPR2_R: a0206-2006.5 (P3.27 RN24.7 SW2.6), a0206-2006.14 (J3.18), a0206-2006.15 (P8.18)
PPI1D11/HPD3/KPR3_R: a0206-2006.5 (P3.25 RN24.8 SW2.5), a0206-2006.14 (J3.17), a0206-2006.15 (P8.19)
PPI1D12/HPD4KPC0_R: a0206-2006.5 (P3.23), a0206-2006.14 (J3.20), a0206-2006.15 (P8.20)
PPI1D13/HPD5/KPC1_R: a0206-2006.5 (P3.21 RN23.6 SW2.3), a0206-2006.14 (J3.19), a0206-2006.15 (P8.21)
PPI1D14/HPD6/KPC2_R: a0206-2006.5 (P3.19 RN23.7 SW2.2), a0206-2006.14 (J3.22), a0206-2006.15 (P8.22)
PPI1D15/HPD7/KPC3_R: a0206-2006.5 (P3.17 RN23.8 SW2.1), a0206-2006.14 (J3.21), a0206-2006.15 (P8.23)
PPI1FS1_R: a0206-2006.5 (R270.2), a0206-2006.14 (J3.41), a0206-2006.15 (P8.31)
PPI1FS2_R: a0206-2006.5 (R271.2), a0206-2006.14 (J3.40), a0206-2006.15 (P8.33)
PPI1FS3/UART1_TX: a0206-2006.5 (JP12.1 R272.2), a0206-2006.11 (R110.2 U32.11), a0206-2006.14 (J3.46), a0206-2006.15 (P8.29)
PUSHBUTTON1: a0206-2006.4 (U2.W8), a0206-2006.13 (SW5.8), a0206-2006.14 (J2.7 J2.26), a0206-2006.15 (P6.28 P7.28 P11.6)
PUSHBUTTON2: a0206-2006.4 (U2.V8), a0206-2006.13 (SW5.7), a0206-2006.14 (J2.23), a0206-2006.15 (P6.30 P7.30 P11.8 P12.3)
PUSHBUTTON3: a0206-2006.4 (U2.U7), a0206-2006.13 (SW5.6), a0206-2006.14 (J3.31), a0206-2006.15 (P6.32 P7.32 P11.10 P12.5)
PUSHBUTTON4/HPWAIT: a0206-2006.4 (U2.W7), a0206-2006.5 (R149.2), a0206-2006.13 (SW5.5), a0206-2006.14 (J1.85)
~{RESET}: a0206-2006.3 (U25.2), a0206-2006.4 (U2.C12), a0206-2006.9 (U14.95), a0206-2006.13 (R130.2 R182.2 U27.7), a0206-2006.14 (J3.28 J3.30), a0206-2006.15 (5 pins)
RFS0: a0206-2006.4 (U2.G2), a0206-2006.7 (R56.1 U11.10)
RFS2: a0206-2006.4 (U2.W11), a0206-2006.14 (J2.39), a0206-2006.15 (P6.7)
RFS3: a0206-2006.4 (U2.Y8), a0206-2006.14 (J2.31), a0206-2006.15 (P7.7)
RSCLK0: a0206-2006.4 (U2.H3), a0206-2006.7 (R61.1)
RSCLK2: a0206-2006.4 (U2.U11), a0206-2006.14 (J2.41), a0206-2006.15 (P6.16)
RSCLK3: a0206-2006.4 (U2.W9), a0206-2006.14 (J2.33), a0206-2006.15 (P7.16)
SCL0: a0206-2006.4 (R139.2 U2.U16), a0206-2006.14 (J2.58), a0206-2006.15 (P6.26 P7.26 P8.38)
SCL1: a0206-2006.4 (R277.2 U2.W5), a0206-2006.14 (J3.89), a0206-2006.15 (P10.5)
SD_CLK: a0206-2006.4 (U2.Y15), a0206-2006.11 (R169.1)
SD_CMD: a0206-2006.4 (U2.W15), a0206-2006.11 (R170.1)
SD_D0: a0206-2006.4 (U2.Y14), a0206-2006.11 (R151.1)
SD_D1: a0206-2006.4 (U2.V13), a0206-2006.11 (R152.1)
SD_D2: a0206-2006.4 (U2.U13), a0206-2006.11 (R153.1)
SD_D3: a0206-2006.4 (U2.W14), a0206-2006.11 (R154.1)
SDA0: a0206-2006.4 (R140.2 U2.W17), a0206-2006.14 (J2.57), a0206-2006.15 (P6.24 P7.24 P8.36)
SDA1: a0206-2006.4 (R276.2 U2.Y2), a0206-2006.14 (J3.90), a0206-2006.15 (P10.6)
SPI0MISO: a0206-2006.3 (R11.2 U6.2), a0206-2006.4 (U2.T17), a0206-2006.12 (R247.1), a0206-2006.14 (J2.12)
SPI0MOSI: a0206-2006.3 (U6.5), a0206-2006.4 (R244.2), a0206-2006.12 (U9.19), a0206-2006.14 (J2.10)
SPI0SCK: a0206-2006.3 (R12.1 U6.6), a0206-2006.4 (R243.2), a0206-2006.12 (U9.26), a0206-2006.14 (J2.9)
SPI0SEL1: a0206-2006.3 (R205.1), a0206-2006.4 (R245.2), a0206-2006.14 (J3.34)
SPI0SEL2: a0206-2006.4 (R246.2), a0206-2006.12 (R206.2 U9.18), a0206-2006.14 (J3.35)
SPI0SEL3: a0206-2006.4 (R255.2), a0206-2006.14 (J2.56 J3.36)
SPI2MISO: a0206-2006.4 (U2.Y5), a0206-2006.14 (J2.8)
SPI2MOSI: a0206-2006.4 (U2.V9), a0206-2006.14 (J2.6)
SPI2SCK: a0206-2006.4 (U2.Y6), a0206-2006.14 (J2.5)
~{TRST}: a0206-2006.4 (U2.T5), a0206-2006.14 (R213.1)
TDI: a0206-2006.4 (U2.V5), a0206-2006.14 (R251.2)
TDO: a0206-2006.4 (U2.V4), a0206-2006.14 (R252.2)
TFS2: a0206-2006.4 (U2.U12), a0206-2006.14 (J2.40), a0206-2006.15 (P6.11)
TFS3: a0206-2006.4 (U2.U10), a0206-2006.14 (J2.32), a0206-2006.15 (P7.11)
TMS: a0206-2006.4 (U2.U5), a0206-2006.14 (R250.2)
TSCLK0: a0206-2006.4 (U2.H1), a0206-2006.7 (R57.1)
TSCLK2: a0206-2006.4 (U2.Y12), a0206-2006.14 (J2.42), a0206-2006.15 (P6.6)
TSCLK3: a0206-2006.4 (U2.V10), a0206-2006.14 (J2.34), a0206-2006.15 (P7.6)
UART1_RX: a0206-2006.5 (U2.U14), a0206-2006.11 (SW7.2), a0206-2006.14 (J3.47)
UART1CTS: a0206-2006.4 (U2.T18), a0206-2006.11 (R99.1 SW7.1)
UART1RTS: a0206-2006.4 (U2.U19), a0206-2006.11 (R111.2 SW7.3)
UART2RX: a0206-2006.3 (SW14.2), a0206-2006.4 (U2.Y3), a0206-2006.14 (J3.5)
UART2TX: a0206-2006.3 (SW14.1), a0206-2006.4 (U2.Y4), a0206-2006.14 (J3.6)
UART3CTS/PB3: a0206-2006.4 (SW16.1 U2.U6), a0206-2006.14 (J3.33)
UART3RTS: a0206-2006.3 (SW14.3), a0206-2006.4 (U2.T6), a0206-2006.14 (J3.32)
UART3RX: a0206-2006.4 (U2.V7), a0206-2006.14 (J3.7), a0206-2006.15 (P12.10)
UART3TX: a0206-2006.4 (U2.W6), a0206-2006.14 (J3.8), a0206-2006.15 (P12.6)
UNREG_IN: a0206-2006.12 (C263.1 C264.1 L5.1), a0206-2006.15 (6 pins), a0206-2006.16 (10 pins), a0206-2006.17 (12 pins)
USB_VRSEL: a0206-2006.4 (SW16.7), a0206-2006.17 (R258.1 R278.1 R279.1)
VDDDDR: a0206-2006.6 (24 pins), a0206-2006.17 (JP6.2 R193.2)
VDDEXT: a0206-2006.6 (68 pins), a0206-2006.16 (JP5.2 R194.2)
VDDINT: a0206-2006.6 (33 pins), a0206-2006.12 (R210.1), a0206-2006.16 (5 pins)
VROUT: a0206-2006.6 (U2.A18 U2.A19), a0206-2006.16 (R207.1)